# Altium schematic sheet simple.SchDoc: =DocumentName
size A4; CompanyName: Intrepid Control Systems, Inc.; Organization: Intrepid Control Systems, Inc.; SheetNumber: 17; SheetTotal: 17; ResponsibleDept: Hardware Engineering; DocumentType: Schematic Drawing; Subtitle: V CAN; ProjectName: V CAN
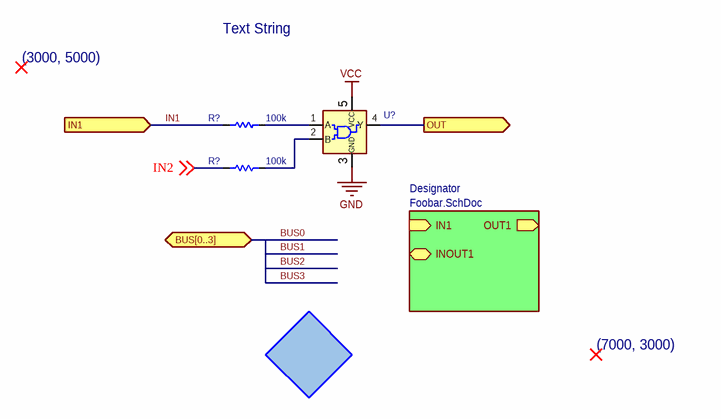
[diagram p0: simple.SchDoc]

## Parts
(Parts that share a designator on the sheet are numbered #1, #2 ... from top to bottom, then left to right.)
R?#1  value 100k  [R0603L]  (hidden comment: MCR03EZPFX1003)
R?#2  value 100k  [R0603L]  (hidden comment: MCR03EZPFX1003)
U?  SN74AHC1G08DBVR  [NA]  (value not drawn)

## Sub-sheets
Designator = Foobar.SchDoc: IN1 (in), OUT1 (out), INOUT1 (bidir)

## Ports
BUS[0..3] (bidir), IN1 (in), OUT (out)

## Nets
GND: U?.3(GND)
VCC: U?.5(VCC)
IN1: R?#1.1 ; port IN1
IN2: R?#2.1 ; off-sheet IN2
OUT: U?.4(Y) ; port OUT
NetR?#1_2: R?#1.2 U?.1(A)
NetR?#2_2: R?#2.2 U?.2(B)

## Notes on the sheet
- (3000, 5000)
- Text String
- (7000, 3000)
- Responsible dept.
- Technical Reference
- Document Type
- Variant
- Rev.
- 1850 Research Drive Troy, MI 48083
- Created By
- Approved By
- Title
- Document Number
- Date of Issue
- Doc. size
- A4
- Sheet
- Notice: The information contained herein is the proprietary property of Intrepid Control Systems, Inc. (ICS). It is not to be reproduced or redistributed In any capacity without the express consent of ICS.

## Library data of the parts
R?#1 R?#2 = R-002: Resistor, Chip, 100k, 100mW, 1%, 0603, +/-100ppm/°C; Part Mounting Type: SMT; Manufacturer: Rohm; ICS PN: R-002; Critical: 0; Top Marking: 104; Part Type: Passive Components, Resistors, Fixed Value; Source: Purchased; Power: 100 mW; Detail 3: 100 mW; Tolerance: 1%; ManufacturerPN: MCR03EZPFX1003; Detail 2: 1%; Detail 1: 100k
U? = IC-171: IC, Gate, AND, 2-5.5V, 2-Input, SOT-23-5; Part Mounting Type: Unspecified; Manufacturer: Texas Instruments; ICS PN: IC-171; Critical: 1; Part Type: Active Components, Semiconductors, Integrated Circuits; Source: Purchased; Package: SOT-23-5; Detail 3: NA; ManufacturerPN: SN74AHC1G08DBVR; Detail 2: NA; Detail 1: NA; Supply Voltage: NA; Detail 4: NA